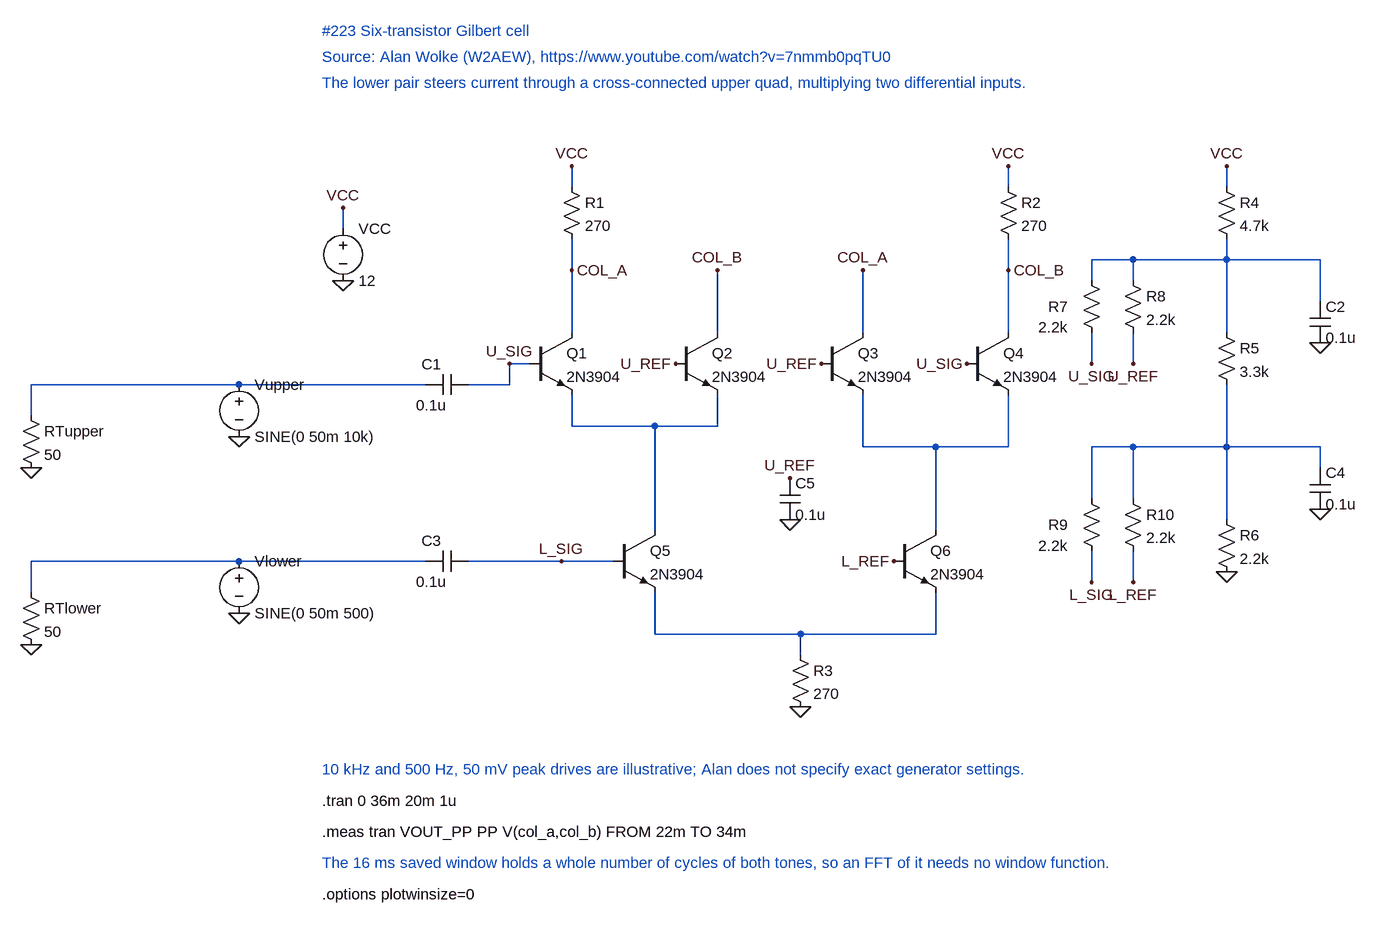
[diagram p0: schematic Six transistor Gilbert cell.asc]
Six transistor Gilbert cell.asc, the LTspice schematic file:
Version 4
SHEET 1 1800 1250
SYMBOL voltage 64 320 R0
SYMATTR InstName VCC
SYMATTR Value 12
WIRE 64 304 64 336
FLAG 64 304 VCC
FLAG 64 416 0
SYMBOL res 400 256 R0
SYMATTR InstName R1
SYMATTR Value 270
WIRE 416 240 416 272
FLAG 416 240 VCC
WIRE 416 352 416 496
FLAG 416 400 COL_A
SYMBOL res 1072 256 R0
SYMATTR InstName R2
SYMATTR Value 270
WIRE 1088 240 1088 272
FLAG 1088 240 VCC
WIRE 1088 352 1088 496
FLAG 1088 400 COL_B
SYMBOL npn 352 496 R0
SYMATTR InstName Q1
SYMATTR Value 2N3904
SYMBOL npn 576 496 R0
SYMATTR InstName Q2
SYMATTR Value 2N3904
SYMBOL npn 800 496 R0
SYMATTR InstName Q3
SYMATTR Value 2N3904
SYMBOL npn 1024 496 R0
SYMATTR InstName Q4
SYMATTR Value 2N3904
WIRE 640 400 640 496
FLAG 640 400 COL_B
WIRE 864 400 864 496
FLAG 864 400 COL_A
WIRE 416 592 416 640
WIRE 416 640 640 640
WIRE 640 592 640 640
WIRE 544 640 544 800
WIRE 864 592 864 672
WIRE 864 672 1088 672
WIRE 1088 592 1088 672
WIRE 976 672 976 800
SYMBOL npn 480 800 R0
SYMATTR InstName Q5
SYMATTR Value 2N3904
SYMBOL npn 912 800 R0
SYMATTR InstName Q6
SYMATTR Value 2N3904
WIRE 544 896 544 960
WIRE 544 960 976 960
WIRE 976 896 976 960
SYMBOL res 752 976 R0
SYMATTR InstName R3
SYMATTR Value 270
WIRE 768 960 768 992
FLAG 768 1072 0
SYMBOL voltage -96 560 R0
SYMATTR InstName Vupper
SYMATTR Value SINE(0 50m 10k)
WIRE -416 576 -96 576
FLAG -96 656 0
SYMBOL cap 256 560 R90
WINDOW 0 0 56 VBottom 2
WINDOW 3 32 56 VTop 2
SYMATTR InstName C1
SYMATTR Value 0.1u
WIRE -96 576 192 576
WIRE -416 576 -416 624
SYMBOL res -432 608 R0
SYMATTR InstName RTupper
SYMATTR Value 50
FLAG -416 704 0
WIRE 256 576 320 576
WIRE 320 544 320 576
WIRE 320 544 352 544
FLAG 320 544 U_SIG
FLAG 1024 544 U_SIG
FLAG 576 544 U_REF
FLAG 800 544 U_REF
SYMBOL cap 736 720 R0
SYMATTR InstName C5
SYMATTR Value 0.1u
FLAG 752 720 U_REF
FLAG 752 784 0
SYMBOL voltage -96 832 R0
SYMATTR InstName Vlower
SYMATTR Value SINE(0 50m 500)
WIRE -416 848 -96 848
FLAG -96 928 0
SYMBOL cap 256 832 R90
WINDOW 0 0 56 VBottom 2
WINDOW 3 32 56 VTop 2
SYMATTR InstName C3
SYMATTR Value 0.1u
WIRE -96 848 192 848
WIRE -416 848 -416 896
SYMBOL res -432 880 R0
SYMATTR InstName RTlower
SYMATTR Value 50
FLAG -416 976 0
WIRE 256 848 480 848
FLAG 400 848 L_SIG
FLAG 912 848 L_REF
SYMBOL res 1408 256 R0
SYMATTR InstName R4
SYMATTR Value 4.7k
WIRE 1424 240 1424 272
FLAG 1424 240 VCC
SYMBOL res 1408 480 R0
SYMATTR InstName R5
SYMATTR Value 3.3k
WIRE 1424 352 1424 496
SYMBOL res 1408 768 R0
SYMATTR InstName R6
SYMATTR Value 2.2k
WIRE 1424 576 1424 784
FLAG 1424 864 0
WIRE 1216 384 1424 384
WIRE 1216 384 1216 416
WIRE 1280 384 1280 416
SYMBOL res 1200 400 R0
WINDOW 0 -20 56 Right 2
WINDOW 3 -20 88 Right 2
SYMATTR InstName R7
SYMATTR Value 2.2k
SYMBOL res 1264 400 R0
SYMATTR InstName R8
SYMATTR Value 2.2k
WIRE 1216 496 1216 544
WIRE 1280 496 1280 544
FLAG 1216 544 U_SIG
FLAG 1280 544 U_REF
WIRE 1216 672 1424 672
WIRE 1216 672 1216 752
WIRE 1280 672 1280 752
SYMBOL res 1200 736 R0
WINDOW 0 -20 56 Right 2
WINDOW 3 -20 88 Right 2
SYMATTR InstName R9
SYMATTR Value 2.2k
SYMBOL res 1264 736 R0
SYMATTR InstName R10
SYMATTR Value 2.2k
WIRE 1216 832 1216 880
WIRE 1280 832 1280 880
FLAG 1216 880 L_SIG
FLAG 1280 880 L_REF
SYMBOL cap 1552 448 R0
SYMATTR InstName C2
SYMATTR Value 0.1u
WIRE 1424 384 1568 384
WIRE 1568 384 1568 448
FLAG 1568 512 0
SYMBOL cap 1552 704 R0
SYMATTR InstName C4
SYMATTR Value 0.1u
WIRE 1424 672 1568 672
WIRE 1568 672 1568 704
FLAG 1568 768 0
TEXT 32 32 Left 2 ;#223 Six-transistor Gilbert cell
TEXT 32 72 Left 2 ;Source: Alan Wolke (W2AEW), https://www.youtube.com/watch?v=7nmmb0pqTU0
TEXT 32 112 Left 2 ;The lower pair steers current through a cross-connected upper quad, multiplying two differential inputs.
TEXT 32 1168 Left 2 ;10 kHz and 500 Hz, 50 mV peak drives are illustrative; Alan does not specify exact generator settings.
TEXT 32 1216 Left 2 !.tran 0 36m 20m 1u
TEXT 32 1360 Left 2 !.options plotwinsize=0
TEXT 32 1264 Left 2 !.meas tran VOUT_PP PP V(col_a,col_b) FROM 22m TO 34m
TEXT 32 1312 Left 2 ;The 16 ms saved window holds a whole number of cycles of both tones, so an FFT of it needs no window function.

The netlist it stands for:
* Six transistor Gilbert cell.asc
VCC VCC 0 12
R1 VCC COL_A 270
R2 VCC COL_B 270
Q1 COL_A U_SIG N001 0 2N3904
Q2 COL_B U_REF N001 0 2N3904
Q3 COL_A U_REF N002 0 2N3904
Q4 COL_B U_SIG N002 0 2N3904
Q5 N001 L_SIG N003 0 2N3904
Q6 N002 L_REF N003 0 2N3904
R3 N003 0 270
Vupper N004 0 SINE(0 50m 10k)
C1 U_SIG N004 0.1u
RTupper N004 0 50
C5 U_REF 0 0.1u
Vlower N005 0 SINE(0 50m 500)
C3 L_SIG N005 0.1u
RTlower N005 0 50
R4 VCC N006 4.7k
R5 N006 N007 3.3k
R6 N007 0 2.2k
R7 N006 U_SIG 2.2k
R8 N006 U_REF 2.2k
R9 N007 L_SIG 2.2k
R10 N007 L_REF 2.2k
C2 N006 0 0.1u
C4 N007 0 0.1u
.model NPN NPN
.model PNP PNP
.lib standard.bjt
* #223 Six-transistor Gilbert cell
* Source: Alan Wolke (W2AEW), https://www.youtube.com/watch?v=7nmmb0pqTU0
* The lower pair steers current through a cross-connected upper quad, multiplying two differential inputs.
* 10 kHz and 500 Hz, 50 mV peak drives are illustrative; Alan does not specify exact generator settings.
.tran 0 36m 20m 1u
.options plotwinsize=0
.meas tran VOUT_PP PP V(col_a,col_b) FROM 22m TO 34m
* The 16 ms saved window holds a whole number of cycles of both tones, so an FFT of it needs no window function.
.backanno
.end